# Altium schematic sheet Test.SchDoc
size A4
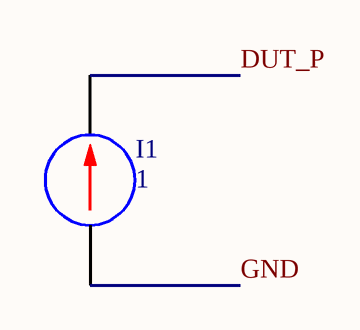
[diagram p0: Test.SchDoc]

## Parts
I1  DC: 1  (hidden comment: DC Current Source)

## Nets
DUT_P: I1.1(+)
GND: I1.2(-)

## Library data of the parts
I1 = DC Current Source: SimulationGenericComponent: True